# Altium schematic sheet Sheet1.SchDoc (part 1 of 3)
size A4; SheetNumber: 1; SheetTotal: 1
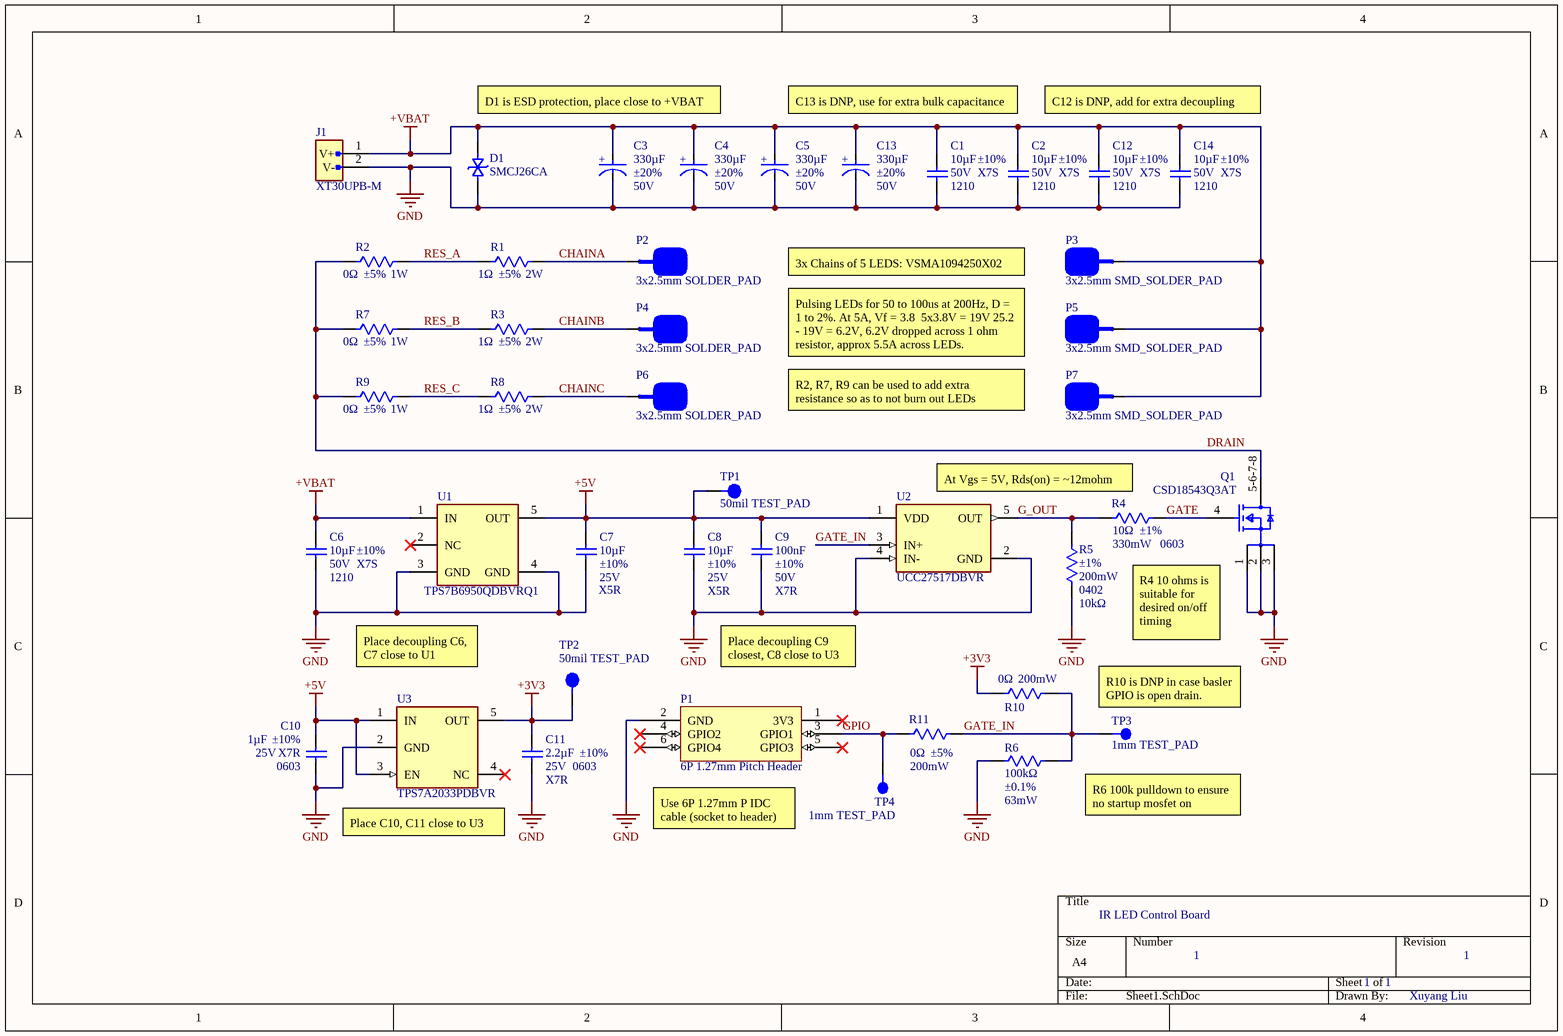
[diagram p0: Sheet1.SchDoc]

## Parts
C1  Voltage Rating: 50V  Tolerance: ±10%  Dielectric: X7S  Case/Package: 1210  Capacitance: 10µF  [1210_CAP]  (hidden comment: 10uF)
C2  Voltage Rating: 50V  Tolerance: ±10%  Dielectric: X7S  Case/Package: 1210  Capacitance: 10µF  [1210_CAP]  (hidden comment: 10uF)
C3  Voltage Rating (DC): 50V  Tolerance: ±20%  Capacitance: 330µF  [CAP_PKPZ_10X16_LOW_RUB]  (hidden comment: 330uF)
C4  Voltage Rating (DC): 50V  Tolerance: ±20%  Capacitance: 330µF  [CAP_PKPZ_10X16_LOW_RUB]  (hidden comment: 330uF)
C5  Voltage Rating (DC): 50V  Tolerance: ±20%  Capacitance: 330µF  [CAP_PKPZ_10X16_LOW_RUB]  (hidden comment: 330uF)
C6  Voltage Rating: 50V  Tolerance: ±10%  Dielectric: X7S  Case/Package: 1210  Capacitance: 10µF  [1210_CAP]  (hidden comment: 10uF)
C7  Voltage Rating: 25V  Tolerance: ±10%  Dielectric: X5R  Capacitance: 10µF  [0603_CAP]  (hidden comment: 10uF)
C8  Voltage Rating: 25V  Tolerance: ±10%  Dielectric: X5R  Capacitance: 10µF  [0603_CAP]  (hidden comment: 10uF)
C9  Voltage Rating: 50V  Tolerance: ±10%  Dielectric: X7R  [0603_CAP]  (hidden comment: 100nF)
C10  Voltage: 25V  Tolerance: ±10%  Dielectric: X7R  Case/Package: 0603  Capacitance: 1µF  [0603_CAP]  (hidden comment: 1uF)
C11  2.2µF  Dielectric Material: X7R  Voltage Rating: 25V  Tolerance: ±10%  Case/Package: 0603  [0603_CAP]
C12  Voltage Rating: 50V  Tolerance: ±10%  Dielectric: X7S  Case/Package: 1210  Capacitance: 10µF  [1210_CAP]  (hidden comment: 10uF)
C13  Voltage Rating (DC): 50V  Tolerance: ±20%  Capacitance: 330µF  [CAP_PKPZ_10X16_LOW_RUB]  (hidden comment: 330uF)
C14  Voltage Rating: 50V  Tolerance: ±10%  Dielectric: X7S  Case/Package: 1210  Capacitance: 10µF  [1210_CAP]  (hidden comment: 10uF)
D1  SMCJ26CA  [SMCJSeries_LTF-M]
J1  XT30UPB-M  [AMASS_XT30UPB-M]
P1  6P 1.27mm Pitch Header  [AMPHENOL_20021121-00006T4LF]
P2  3x2.5mm SOLDER_PAD  [SOLDER_PAD_SMD]
P3  3x2.5mm SMD_SOLDER_PAD  [SOLDER_PAD_SMD]
P4  3x2.5mm SOLDER_PAD  [SOLDER_PAD_SMD]
P5  3x2.5mm SMD_SOLDER_PAD  [SOLDER_PAD_SMD]
P6  3x2.5mm SOLDER_PAD  [SOLDER_PAD_SMD]
P7  3x2.5mm SMD_SOLDER_PAD  [SOLDER_PAD_SMD]
Q1  CSD18543Q3AT  [FP-DNH0008A-MFG]
R1  Tolerance: ±5%  Power Rating: 2W  [2512_RES]  (hidden comment: 1Ω)
R2  Power Rating: 1W  Tolerance: ±5%  [2512_RES]  (hidden comment: 0Ω)
R3  Tolerance: ±5%  Power Rating: 2W  [2512_RES]  (hidden comment: 1Ω)
R4  Power Rating: 330mW  Case Code (Imperial): 0603  Tolerance: ±1%  [0603_RES]  (hidden comment: 10Ω)
R5  Tolerance: ±1%  Power Rating: 200mW  Case/Package: 0402  Resistance: 10kΩ  [0402_RES]  (hidden comment: 10K)
R6  Tolerance: ±0.1%  Resistance: 100kΩ  Max Power Dissipation: 63mW  [0402_RES]  (hidden comment: 100K)
R7  Power Rating: 1W  Tolerance: ±5%  [2512_RES]  (hidden comment: 0Ω)
R8  Tolerance: ±5%  Power Rating: 2W  [2512_RES]  (hidden comment: 1Ω)
R9  Power Rating: 1W  Tolerance: ±5%  [2512_RES]  (hidden comment: 0Ω)
R10  Power Rating: 200mW  Resistance: 0Ω  [0402_RES]  (hidden comment: 0R)
R11  Tolerance: ±5%  Power Rating: 200mW  Resistance: 0Ω  [0402_RES]  (hidden comment: 0R)
TP1  50mil TEST_PAD  [15mil_TEST_PAD]
TP2  50mil TEST_PAD  [15mil_TEST_PAD]
TP3  1mm TEST_PAD  [1mm_TEST_PAD]
TP4  1mm TEST_PAD  [1mm_TEST_PAD]
U1  TPS7B6950QDBVRQ1  [FP-DBV0005A-MFG]
U2  UCC27517DBVR  [FP-DBV0005A-MFG]
U3  TPS7A2033PDBVR  [FP-DBV0005A-MFG]

## Nets
+3V3: C11.2 R10.1 TP2.1 U3.5(OUT)
+5V: C7.2 C8.2 C9.2 C10.2 TP1.1 U1.5(OUT) U2.1(VDD) U3.1(IN) U3.3(EN)
+VBAT: C1.2 C2.2 C3.1(A) C4.1(A) C5.1(A) C6.2 C12.2 C13.1(A) C14.2 D1.2 J1.1(V+) P3.1 P5.1 P7.1 U1.1(IN)
GND: C1.1 C2.1 C3.2(C) C4.2(C) C5.2(C) C6.1 C7.1 C8.1 C9.1 C10.1 C11.1 C12.1 C13.2(C) C14.1 D1.1 J1.2(V-) P1.2(GND) Q1.1(S) Q1.2(S) Q1.3(S) R5.1 R6.1 U1.3(GND) U1.4(GND) U2.2(GND) U2.4(IN-) U3.2(GND)
CHAINA: P2.1 R1.1
CHAINB: P4.1 R3.1
CHAINC: P6.1 R8.1
DRAIN: Q1.5-6-7-8(D) R2.1 R7.1 R9.1
G_OUT: R4.1 R5.2 U2.5(OUT)
GATE: Q1.4(G) R4.2
GATE_IN: R6.2 R10.2 R11.2 TP3.1 U2.3(IN+)
GPIO: P1.3(GPIO1) R11.1 TP4.1
RES_A: R1.2 R2.2
RES_B: R3.2 R7.2
RES_C: R8.2 R9.2

Not connected (* = marked no-connect by the designer): P1 1(3V3)* 4(GPIO2)* 5(GPIO3)* 6(GPIO4)*; U1 2(NC)*; U3 4(NC)*

## Notes on the sheet
- D1 is ESD protection, place close to +VBAT
- C13 is DNP, use for extra bulk capacitance
- C12 is DNP, add for extra decoupling
- 3x Chains of 5 LEDS: VSMA1094250X02
- Pulsing LEDs for 50 to 100us at 200Hz, D = 1 to 2%. At 5A, Vf = 3.8  5x3.8V = 19V 25.2 - 19V = 6.2V, 6.2V dropped across 1 ohm resistor, approx 5.5A across LEDs.
- R2, R7, R9 can be used to add extra resistance so as to not burn out LEDs
- At Vgs = 5V, Rds(on) = ~12mohm
- (near Q1) R4 10 ohms is suitable for desired on/off timing
- Place decoupling C6, C7 close to U1
- Place decoupling C9 closest, C8 close to U3
- (near TP3) R10 is DNP in case basler GPIO is open drain.
- Place C10, C11 close to U3
- (near P1) Use 6P 1.27mm P IDC cable (socket to header)
- R6 100k pulldown to ensure no startup mosfet on
- IR LED Control Board
- 1
- 1     1
- Xuyang Liu
- (in symbol 50ZLJ330M10X16) +